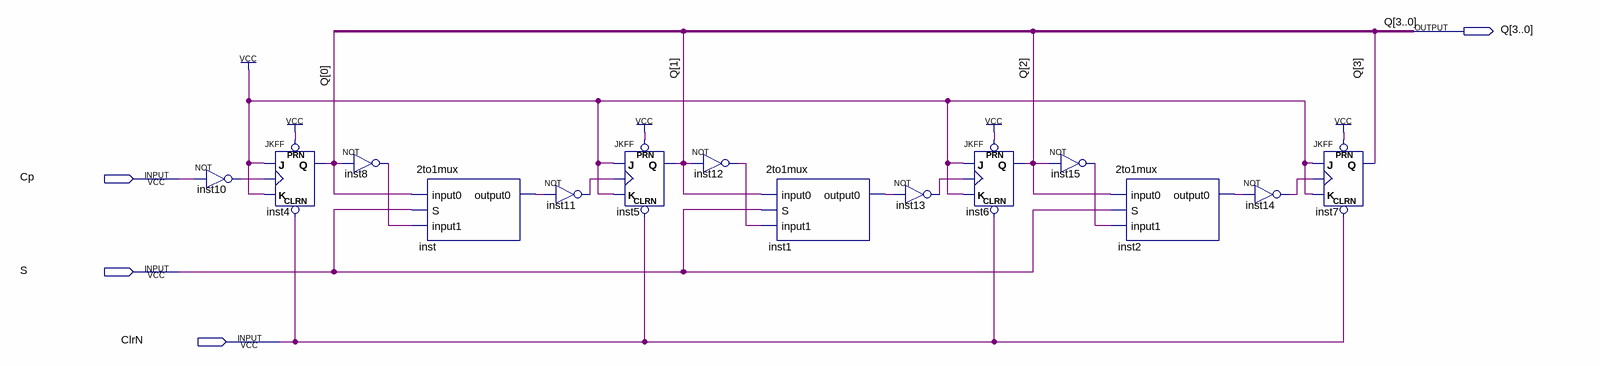
[diagram p0: schematic sheet]
// Quartus schematic RippleUpdown.bdf as structural Verilog: 14 symbols, 4 pins
module RippleUpdown (
  input  Cp,
  input  S,
  input  ClrN,
  output [3:0] Q
);

  wire inst1_output0, inst2_output0, inst8_out, inst10_out, inst11_out, inst12_out, inst13_out, inst14_out,
       inst15_out, inst_output0;

  not inst10 (inst10_out, Cp);
  JKFF inst4 (.PRN(1'b1), .CLRN(ClrN), .K(1'b1), .J(1'b1), .CLK(inst10_out), .Q(Q[0]));
  not inst8 (inst8_out, Q[0]);
  \2to1mux  inst (.input0(Q[0]), .S(S), .input1(inst8_out), .output0(inst_output0));
  not inst11 (inst11_out, inst_output0);
  JKFF inst5 (.PRN(1'b1), .CLRN(ClrN), .K(1'b1), .J(1'b1), .CLK(inst11_out), .Q(Q[1]));
  not inst12 (inst12_out, Q[1]);
  \2to1mux  inst1 (.input0(Q[1]), .S(S), .input1(inst12_out), .output0(inst1_output0));
  not inst13 (inst13_out, inst1_output0);
  JKFF inst6 (.PRN(1'b1), .CLRN(ClrN), .K(1'b1), .J(1'b1), .CLK(inst13_out), .Q(Q[2]));
  not inst15 (inst15_out, Q[2]);
  \2to1mux  inst2 (.input0(Q[2]), .S(S), .input1(inst15_out), .output0(inst2_output0));
  not inst14 (inst14_out, inst2_output0);
  JKFF inst7 (.PRN(1'b1), .CLRN(ClrN), .K(1'b1), .J(1'b1), .CLK(inst14_out), .Q(Q[3]));
endmodule
